# Altium schematic sheet STM32.SchDoc
size D; SheetNumber: 1; SheetTotal: 5; SPICEModelCacheVGJZVZGD: <root> / <DocumentId>VGJZVZGD</DocumentId> / </root>
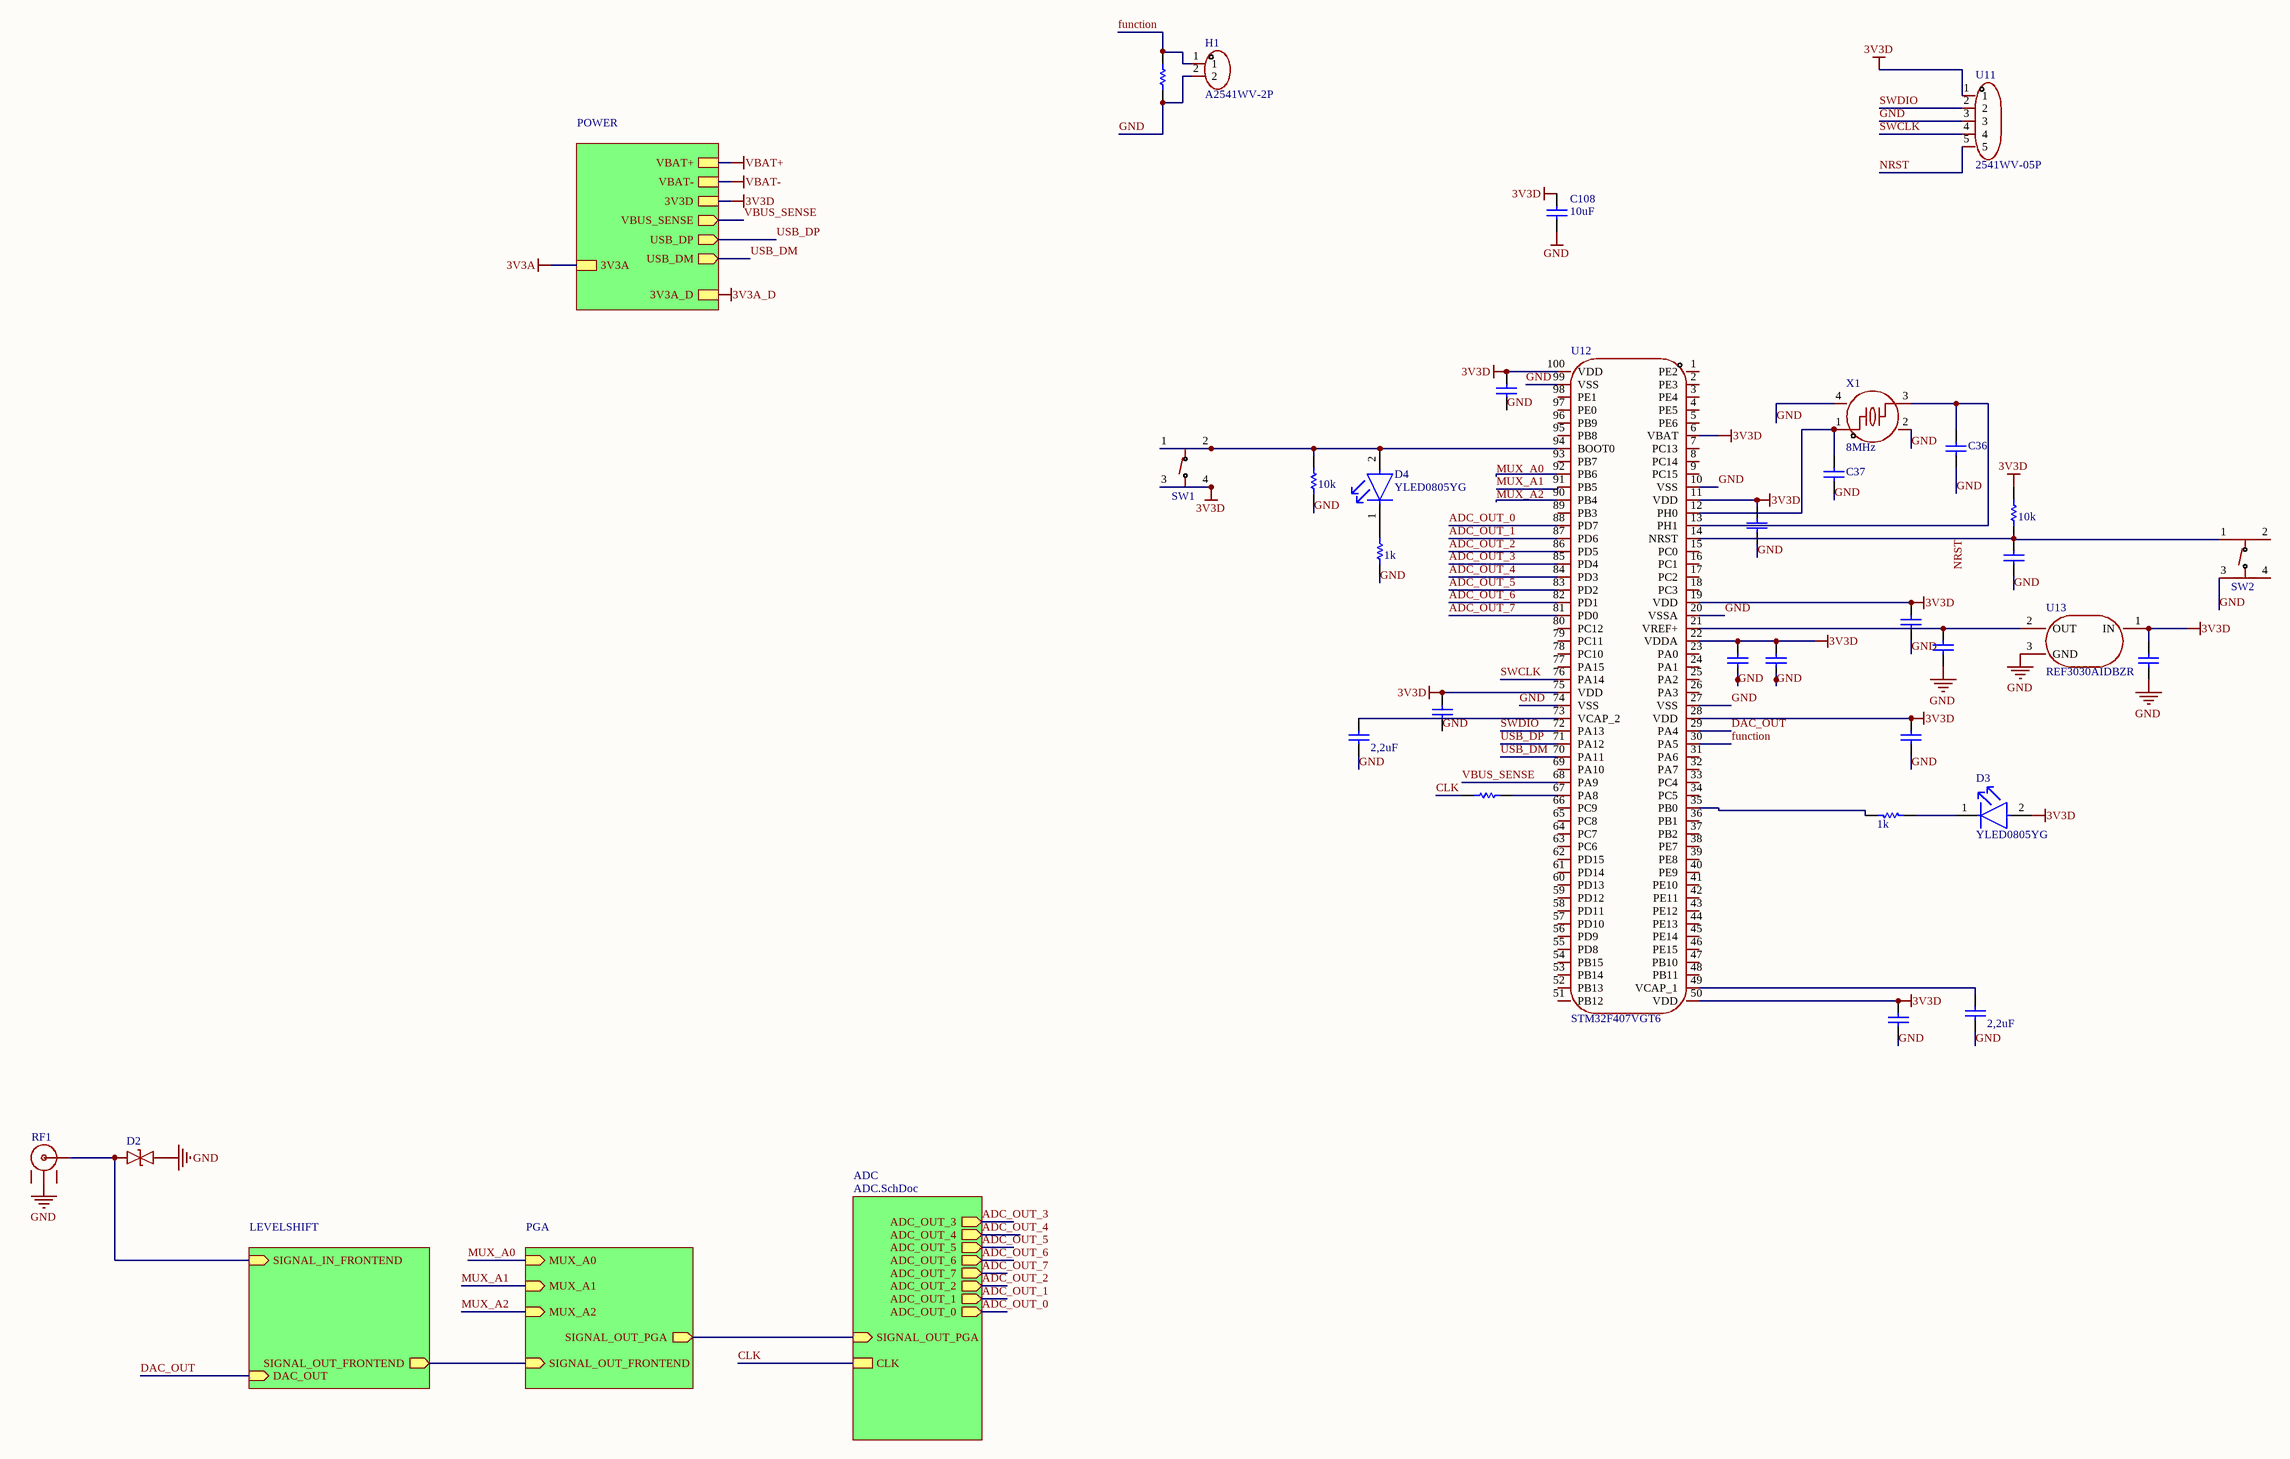
[diagram p0: STM32.SchDoc]

## Parts
C35  Cap  [0603]  (value not drawn)
C36  Cap  [0603]  (value not drawn)
C37  Cap  [0603]  (value not drawn)
C38  Cap  [0603]  (value not drawn)
C39  Cap  [0603]  (value not drawn)
C40  Cap  [0603]  (value not drawn)
C41  Cap  [0603]  (value not drawn)
C42  Cap  [0603]  (value not drawn)
C43  Cap  [0603]  (value not drawn)
C44  Cap  [0603]  (value not drawn)
C45  Cap  [0603]  (value not drawn)
C46  value 2,2uF  [0603]  (hidden comment: Cap)
C47  Cap  [0603]  (value not drawn)
C48  value 2,2uF  [0603]  (hidden comment: Cap)
C49  Cap  [0603]  (value not drawn)
C108  value 10uF  [0603]  (hidden comment: Cap)
D2  GBLC08CI-LF-T7  [SOD-323_L1.8-W1.3-LS2.5-BI]  (value not drawn)
D3  YLED0805YG  [FP-LTST-C171KGKT-MFG]
D4  YLED0805YG  [FP-LTST-C171KGKT-MFG]
H1  A2541WV-2P  [HDR-TH_P2.54-H-M_A2541WV-2P]
R40  value 10k  [0603]  (hidden comment: Res1)
R41  value 10k  [0603]  (hidden comment: Res1)
R45  Res1  [0603]  (value not drawn)
R46  value 1k  [0603]  (hidden comment: Res1)
R102  value 1k  [0603]  (hidden comment: Res1)
R103  Res1  [0603]  (value not drawn)
RF1  3GHz  [ANT-TH_KH-BNC50-3511]  (value not drawn)
SW1  TS-1187A-B-A-B  [SKQGABE010]  (value not drawn)
SW2  TS-1187A-B-A-B  [SKQGABE010]  (value not drawn)
U11  2541WV-05P  [HDR-TH_5P-P2.54-V-M]
U12  STM32F407VGT6  [LQFP-100_L14.0-W14.0-P0.50-LS16.0-BL]
U13  REF3030AIDBZR  [SOT-23-3_L2.9-W1.6-P1.90-LS2.8-BR_2]
X1  8MHz  [CRYSTAL-SMD_4P-L3.2-W2.5-BL]

## Sub-sheets
ADC = ADC.SchDoc: CLK, ADC_OUT_3 (out), ADC_OUT_4 (out), ADC_OUT_5 (out), ADC_OUT_6 (out), ADC_OUT_7 (out), ADC_OUT_2 (out), ADC_OUT_1 (out), ADC_OUT_0 (out), SIGNAL_OUT_PGA (in)
LEVELSHIFT = FrontEnd.SchDoc: SIGNAL_IN_FRONTEND (in), SIGNAL_OUT_FRONTEND (out), DAC_OUT (in)
PGA = Amplifier.SchDoc: MUX_A0 (in), MUX_A1 (in), MUX_A2 (in), SIGNAL_OUT_FRONTEND (in), SIGNAL_OUT_PGA (out)
POWER = Power.SchDoc: VBAT+, VBAT-, VBUS_SENSE (out), USB_DP (out), USB_DM (out), 3V3A, 3V3D, 3V3A_D

## Nets
3V3A: sheet POWER/3V3A
3V3A_D: sheet POWER/3V3A_D
3V3D: C35.2 C38.2 C40.2 C42.2 C43.2 C44.2 C45.2 C47.2 C49.2 C108.2 D3.2(A) R41.1 SW1.3(C) SW1.4(D) U11.1 U12.6(VBAT) U12.11(VDD) U12.19(VDD) U12.22(VDDA) U12.28(VDD) U12.50(VDD) U12.75(VDD) U12.100(VDD) U13.1(IN) ; sheet POWER/3V3D
GND: C35.1 C36.1 C37.1 C38.1 C39.1 C40.1 C41.1 C42.1 C43.1 C44.1 C45.1 C46.2 C47.1 C48.2 C49.1 C108.1 D2.2(A) H1.2 R40.2 R102.2 R103.2 RF1.2 SW2.3(C) U11.3 U12.10(VSS) U12.20(VSSA) U12.27(VSS) U12.74(VSS) U12.99(VSS) U13.3(GND) X1.2(GND) X1.4(GND)
VBAT+: sheet POWER/VBAT+
VBAT-: sheet POWER/VBAT-
ADC_OUT_0: U12.88(PD7) ; sheet ADC/ADC_OUT_0
ADC_OUT_1: U12.87(PD6) ; sheet ADC/ADC_OUT_1
ADC_OUT_2: U12.86(PD5) ; sheet ADC/ADC_OUT_2
ADC_OUT_3: U12.85(PD4) ; sheet ADC/ADC_OUT_3
ADC_OUT_4: U12.84(PD3) ; sheet ADC/ADC_OUT_4
ADC_OUT_5: U12.83(PD2) ; sheet ADC/ADC_OUT_5
ADC_OUT_6: U12.82(PD1) ; sheet ADC/ADC_OUT_6
ADC_OUT_7: U12.81(PD0) ; sheet ADC/ADC_OUT_7
CLK: R45.2 ; sheet ADC/CLK
DAC_OUT: U12.29(PA4) ; sheet LEVELSHIFT/DAC_OUT
function: H1.1 R103.1 U12.30(PA5)
MUX_A0: U12.92(PB6) ; sheet PGA/MUX_A0
MUX_A1: U12.91(PB5) ; sheet PGA/MUX_A1
MUX_A2: U12.90(PB4) ; sheet PGA/MUX_A2
NRST: C39.2 R41.2 SW2.1(A) U11.5 U12.14(NRST)
SWCLK: U11.4 U12.76(PA14)
SWDIO: U11.2 U12.72(PA13)
USB_DM: U12.70(PA11) ; sheet POWER/USB_DM
USB_DP: U12.71(PA12) ; sheet POWER/USB_DP
VBUS_SENSE: U12.68(PA9) ; sheet POWER/VBUS_SENSE
NetC36_2: C36.2 U12.13(PH1) X1.3
NetC37_2: C37.2 U12.12(PH0) X1.1
NetC41_2: C41.2 U12.21(VREF+) U13.2(OUT)
NetC46_1: C46.1 U12.73(VCAP_2)
NetC48_1: C48.1 U12.49(VCAP_1)
NetD2_1: D2.1(K) RF1.1(OUT) ; sheet LEVELSHIFT/SIGNAL_IN_FRONTEND
NetD3_1: D3.1(C) R46.2
NetD4_1: D4.1(C) R102.1
NetD4_2: D4.2(A) R40.1 SW1.1(A) SW1.2(B) U12.94(BOOT0)
NetR45_1: R45.1 U12.67(PA8)
NetR46_1: R46.1 U12.35(PB0)
(unnamed): sheet ADC/SIGNAL_OUT_PGA, sheet PGA/SIGNAL_OUT_PGA
(unnamed): sheet LEVELSHIFT/SIGNAL_OUT_FRONTEND, sheet PGA/SIGNAL_OUT_FRONTEND

Not connected (* = marked no-connect by the designer): RF1 3 4; SW2 2(B) 4(D); U12 1(PE2) 2(PE3) 3(PE4) 4(PE5) 5(PE6) 7(PC13) 8(PC14) 9(PC15) 15(PC0) 16(PC1) 17(PC2) 18(PC3) 23(PA0) 24(PA1) 25(PA2) 26(PA3) 31(PA6) 32(PA7) 33(PC4) 34(PC5) 36(PB1) 37(PB2) 38(PE7) 39(PE8) 40(PE9) 41(PE10) 42(PE11) 43(PE12) 44(PE13) 45(PE14) 46(PE15) 47(PB10) 48(PB11) 51(PB12) 52(PB13) 53(PB14) 54(PB15) 55(PD8) 56(PD9) 57(PD10) 58(PD11) 59(PD12) 60(PD13) 61(PD14) 62(PD15) 63(PC6) 64(PC7) 65(PC8) 66(PC9) 69(PA10) 77(PA15) 78(PC10) 79(PC11) 80(PC12) 89(PB3) 93(PB7) 95(PB8) 96(PB9) 97(PE0) 98(PE1)

## Library data of the parts
C35 C38-C42 C44 C45 C47 C49 = Cap: Capacitor; Value: 100nF; Published: 8-Jun-2000; LatestRevisionDate: 17-Jul-2002; LatestRevisionNote: Re-released for DXP Platform.; PackageReference: RAD-0.3; Publisher: Altium Limited; PackageDescription: Radial Cap, Thru-Hole; 2 Leads; 0.3 in Pin Spacing
C36 C37 = Cap: Capacitor; Value: 22pF; Published: 8-Jun-2000; LatestRevisionDate: 17-Jul-2002; LatestRevisionNote: Re-released for DXP Platform.; PackageReference: RAD-0.3; Publisher: Altium Limited; PackageDescription: Radial Cap, Thru-Hole; 2 Leads; 0.3 in Pin Spacing
C43 = Cap: Capacitor; Value: 1uF; Published: 8-Jun-2000; LatestRevisionDate: 17-Jul-2002; LatestRevisionNote: Re-released for DXP Platform.; PackageReference: RAD-0.3; Publisher: Altium Limited; PackageDescription: Radial Cap, Thru-Hole; 2 Leads; 0.3 in Pin Spacing
C46 C48 C108 = Cap: Capacitor; Published: 8-Jun-2000; LatestRevisionDate: 17-Jul-2002; LatestRevisionNote: Re-released for DXP Platform.; PackageReference: RAD-0.3; Publisher: Altium Limited; PackageDescription: Radial Cap, Thru-Hole; 2 Leads; 0.3 in Pin Spacing
D2 = GBLC08CI-LF-T7: Bidirectional TVS/ESD protection diode, 8 V standoff, 13.4 V clamping, 0.6 pF capacitance
D3 D4 = CMP-22017-000037-1: LED GREEN CLEAR SMD; Number of LEDs: 1; Viewing Angle: 130°; Lens Style: Rectangular; Dominant Wavelength: 571nm; Test Current: 20mA; Luminous Intensity: 35mcd; Power Rating: 75mW; Forward Voltage: 2.4V; Forward Current: 30mA; Reverse Voltage: 5V; Lens Color: Colorless; Wavelength: 574nm; Height: 0.8mm; Illumination Color: Green; Length: 2mm; Case/Package: 0805; Number of Pins: 2; Number of Elements: 1; Package Quantity: 1; Depth: 1.25mm; Lens Transparency: Clear; Width: 1.25mm; Color: Green; Radiation Hardening: No; Mount: Surface Mount; Packaging: Tape and Reel; Case Code (Metric): 2012; Lead Free: Lead Free; Max Operating Temperature: 85°C; Min Operating Temperature: -55°C; Case Code (Imperial): 0805; Power Dissipation: 75mW
H1 = A2541WV-2P_C225477: 2-pin male pin header, 2.54 mm pitch, single-row, straight through-hole, 3 A, 250 V.
R40 R41 R46 R102 = Res1: Resistor; Published: 8-Jun-2000; LatestRevisionDate: 17-Jul-2002; LatestRevisionNote: Re-released for DXP Platform.; PackageReference: AXIAL-0.3; Publisher: Altium Limited; PackageDescription: Axial Device, Thru-Hole; 2 Leads; 0.3 in Pin Spacing
R45 = Res1: Resistor; Value: 22; Published: 8-Jun-2000; LatestRevisionDate: 17-Jul-2002; LatestRevisionNote: Re-released for DXP Platform.; PackageReference: AXIAL-0.3; Publisher: Altium Limited; PackageDescription: Axial Device, Thru-Hole; 2 Leads; 0.3 in Pin Spacing
R103 = Res1: Resistor; Value: 1k; Published: 8-Jun-2000; LatestRevisionDate: 17-Jul-2002; LatestRevisionNote: Re-released for DXP Platform.; PackageReference: AXIAL-0.3; Publisher: Altium Limited; PackageDescription: Axial Device, Thru-Hole; 2 Leads; 0.3 in Pin Spacing
RF1 = KH-BNC50-3511: 50 Ω right-angle BNC PCB connector, through-hole, DC–3 GHz, 9.5 mm interface
SW1 SW2 = TS-1187A-B-A-B: SMD tactile pushbutton switch, SPST-NO, 12 V, 50 mA, 5.1 × 5.1 × 1.5 mm.
U11 = 2541WV-05P: 5-pin single-row male pin header, 2.54 mm pitch, through-hole, straight.
U13 = REF3030AIDBZR: 3.0 V precision voltage reference, ±0.2% accuracy, 25 mA output
X1 = 0132M4-8000F18DZNGL